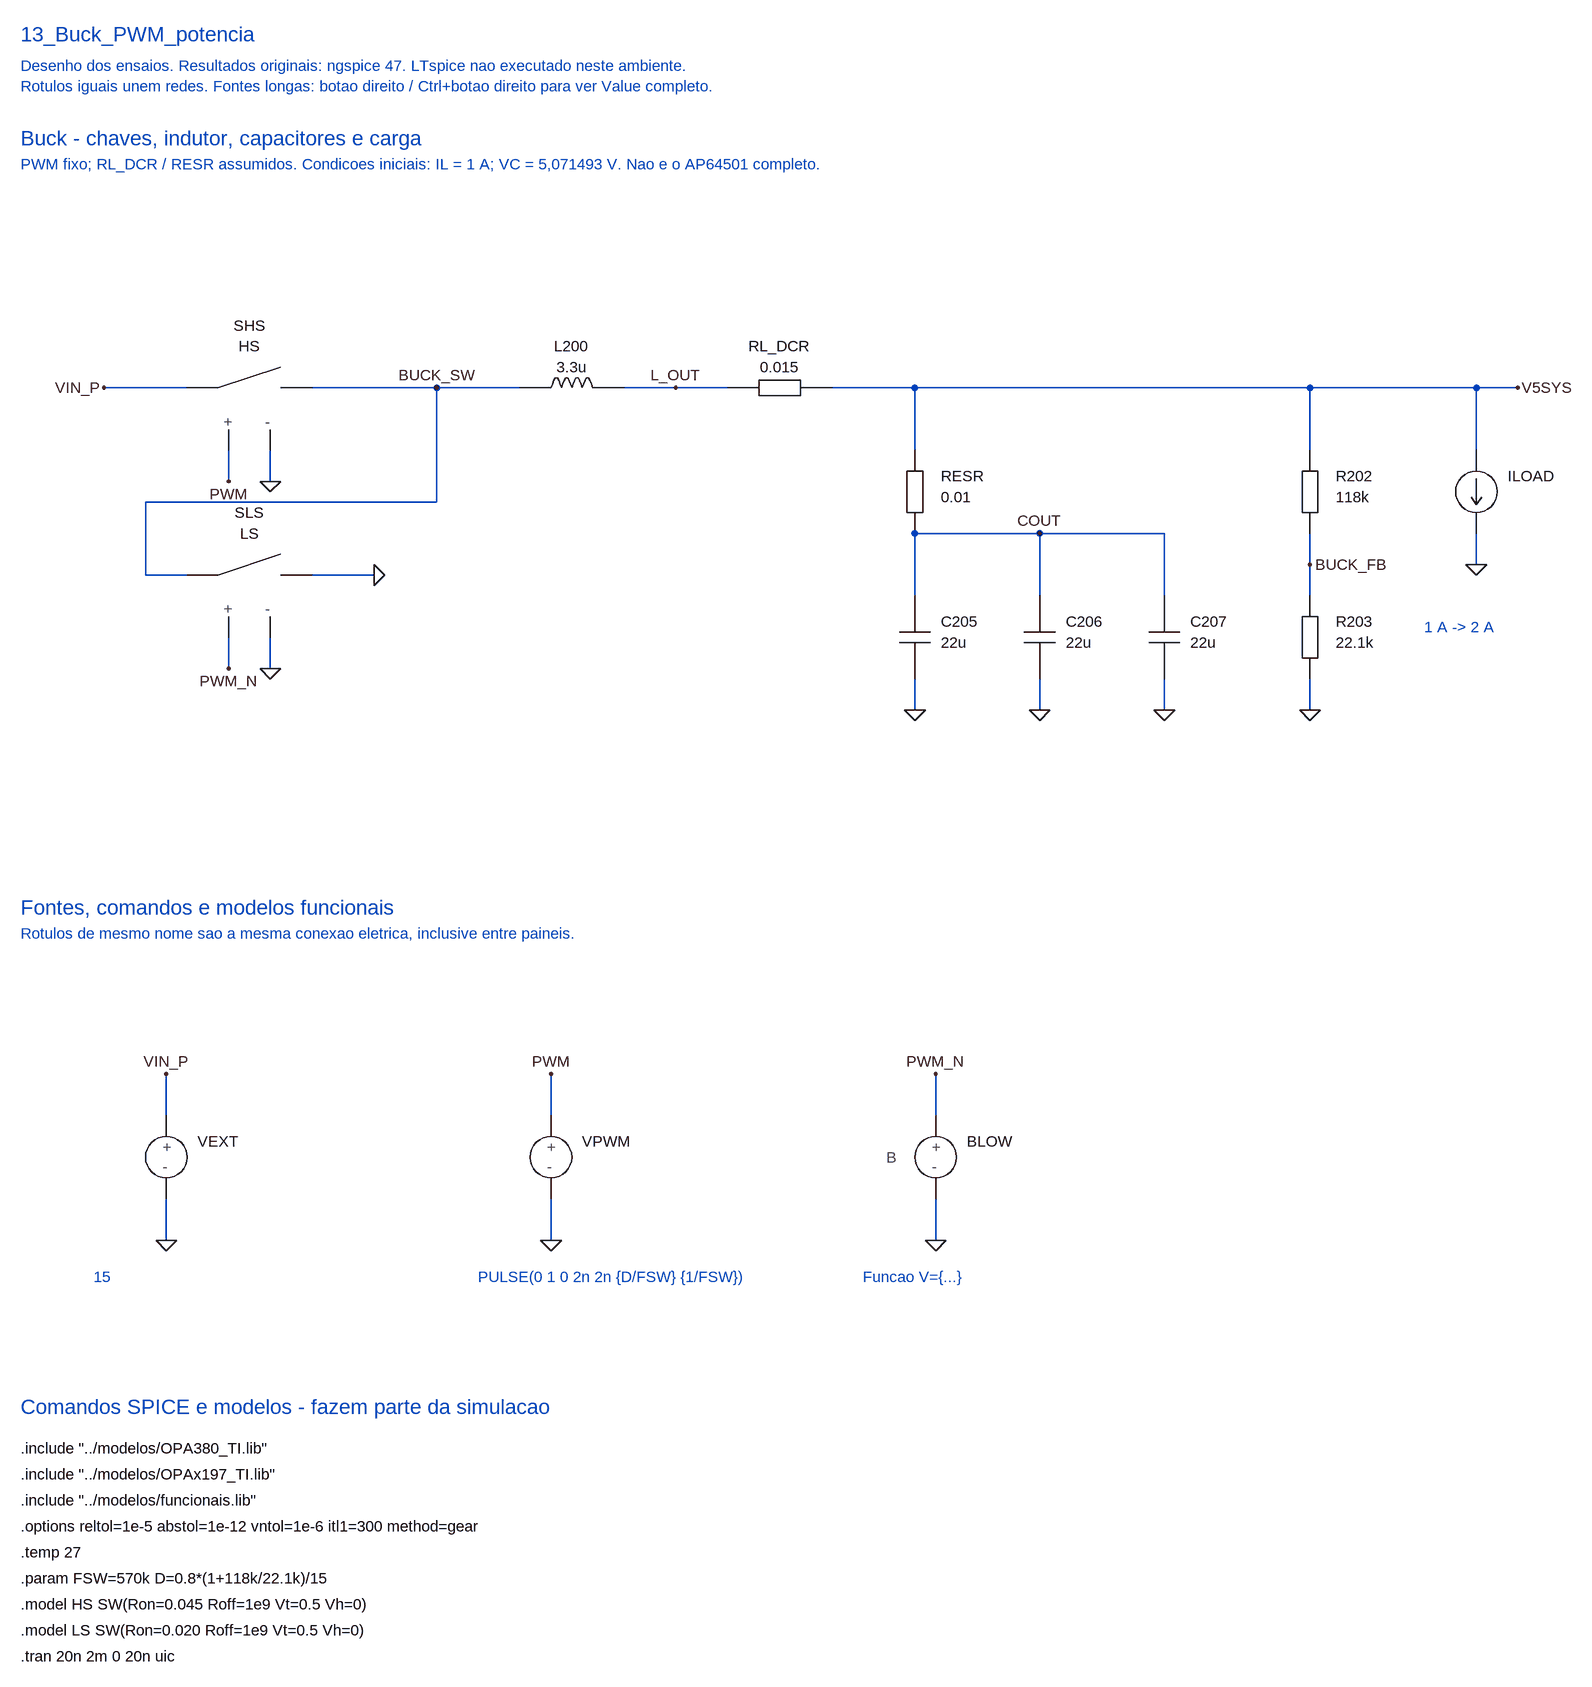
[diagram p0: schematic 13_Buck_PWM_potencia.asc]
13_Buck_PWM_potencia.asc, the LTspice schematic file:
Version 4.1
SHEET 1 2656 2664
TEXT 64 32 Left 3 ;13_Buck_PWM_potencia
TEXT 64 80 Left 2 ;Desenho dos ensaios. Resultados originais: ngspice 47. LTspice nao executado neste ambiente.
TEXT 64 112 Left 2 ;Rotulos iguais unem redes. Fontes longas: botao direito / Ctrl+botao direito para ver Value completo.
TEXT 64 192 Left 3 ;Buck - chaves, indutor, capacitores e carga
TEXT 64 232 Left 2 ;PWM fixo; RL_DCR / RESR assumidos. Condicoes iniciais: IL = 1 A; VC = 5,071493 V. Nao e o AP64501 completo.
WIRE 320 576 192 576
WIRE 512 576 832 576
WIRE 320 864 256 864
WIRE 256 864 256 752
WIRE 256 752 704 752
WIRE 704 752 704 576
WIRE 512 864 608 864
WIRE 384 672 384 720
WIRE 448 672 448 720
WIRE 384 960 384 1008
WIRE 448 960 448 1008
WIRE 992 576 1152 576
WIRE 1312 576 2368 576
WIRE 1440 576 1440 672
WIRE 1440 800 1824 800
WIRE 1440 800 1440 896
WIRE 1440 1024 1440 1072
WIRE 1632 800 1632 896
WIRE 1632 1024 1632 1072
WIRE 1824 800 1824 896
WIRE 1824 1024 1824 1072
WIRE 2048 576 2048 672
WIRE 2048 800 2048 896
WIRE 2048 1024 2048 1072
WIRE 2304 576 2304 672
WIRE 2304 800 2304 848
FLAG 192 576 VIN_P
FLAG 704 576 BUCK_SW
FLAG 608 864 0
FLAG 384 720 PWM
FLAG 448 720 0
FLAG 384 1008 PWM_N
FLAG 448 1008 0
FLAG 1072 576 L_OUT
FLAG 2368 576 V5SYS
FLAG 1632 800 COUT
FLAG 1440 1072 0
FLAG 1632 1072 0
FLAG 1824 1072 0
FLAG 2048 848 BUCK_FB
FLAG 2048 1072 0
FLAG 2304 848 0
SYMBOL CV_SW 384 576 R0
SYMATTR InstName SHS
SYMATTR Value HS
SYMBOL CV_SW 384 864 R0
SYMATTR InstName SLS
SYMATTR Value LS
SYMBOL CV_LH 832 576 R0
SYMATTR InstName L200
SYMATTR Value 3.3u
SYMATTR SpiceLine IC=1
SYMBOL CV_RH 1152 576 R0
SYMATTR InstName RL_DCR
SYMATTR Value 0.015
SYMBOL CV_RV 1440 672 R0
SYMATTR InstName RESR
SYMATTR Value 0.01
SYMBOL CV_CV 1440 896 R0
SYMATTR InstName C205
SYMATTR Value 22u
SYMATTR SpiceLine IC=5.071493
SYMBOL CV_CV 1632 896 R0
SYMATTR InstName C206
SYMATTR Value 22u
SYMATTR SpiceLine IC=5.071493
SYMBOL CV_CV 1824 896 R0
SYMATTR InstName C207
SYMATTR Value 22u
SYMATTR SpiceLine IC=5.071493
SYMBOL CV_RV 2048 672 R0
SYMATTR InstName R202
SYMATTR Value 118k
SYMBOL CV_RV 2048 896 R0
SYMATTR InstName R203
SYMATTR Value 22.1k
SYMBOL CV_I 2304 672 R0
SYMATTR InstName ILOAD
SYMATTR Value PWL(0 1 1m 1 1.001m 2)
TEXT 2224 944 Left 2 ;1 A -> 2 A
TEXT 64 1376 Left 3 ;Fontes, comandos e modelos funcionais
TEXT 64 1416 Left 2 ;Rotulos de mesmo nome sao a mesma conexao eletrica, inclusive entre paineis.
WIRE 288 1696 288 1632
WIRE 288 1824 288 1888
WIRE 880 1696 880 1632
WIRE 880 1824 880 1888
WIRE 1472 1696 1472 1632
WIRE 1472 1824 1472 1888
FLAG 288 1632 VIN_P
FLAG 288 1888 0
FLAG 880 1632 PWM
FLAG 880 1888 0
FLAG 1472 1632 PWM_N
FLAG 1472 1888 0
SYMBOL CV_V 288 1696 R0
SYMATTR InstName VEXT
SYMATTR Value 15
SYMBOL CV_V 880 1696 R0
SYMATTR InstName VPWM
SYMATTR Value PULSE(0 1 0 2n 2n {D/FSW} {1/FSW})
SYMBOL CV_B 1472 1696 R0
SYMATTR InstName BLOW
SYMATTR Value V={1-V(PWM)}
TEXT 176 1944 Left 2 ;15
TEXT 768 1944 Left 2 ;PULSE(0 1 0 2n 2n {D/FSW} {1/FSW})
TEXT 1360 1944 Left 2 ;Funcao V={...}
TEXT 64 2144 Left 3 ;Comandos SPICE e modelos - fazem parte da simulacao
TEXT 64 2208 Left 2 !.include "../modelos/OPA380_TI.lib"
TEXT 64 2248 Left 2 !.include "../modelos/OPAx197_TI.lib"
TEXT 64 2288 Left 2 !.include "../modelos/funcionais.lib"
TEXT 64 2328 Left 2 !.options reltol=1e-5 abstol=1e-12 vntol=1e-6 itl1=300 method=gear
TEXT 64 2368 Left 2 !.temp 27
TEXT 64 2408 Left 2 !.param FSW=570k D=0.8*(1+118k/22.1k)/15
TEXT 64 2448 Left 2 !.model HS SW(Ron=0.045 Roff=1e9 Vt=0.5 Vh=0)
TEXT 64 2488 Left 2 !.model LS SW(Ron=0.020 Roff=1e9 Vt=0.5 Vh=0)
TEXT 64 2528 Left 2 !.tran 20n 2m 0 20n uic

The netlist it stands for:
* 13_Buck_PWM_potencia.asc
SHS VIN_P BUCK_SW PWM 0 HS
SLS BUCK_SW 0 PWM_N 0 LS
L200 BUCK_SW L_OUT 3.3u IC=1
RL_DCR L_OUT V5SYS 0.015
RESR V5SYS COUT 0.01
C205 COUT 0 22u IC=5.071493
C206 COUT 0 22u IC=5.071493
C207 COUT 0 22u IC=5.071493
R202 V5SYS BUCK_FB 118k
R203 BUCK_FB 0 22.1k
ILOAD V5SYS 0 PWL(0 1 1m 1 1.001m 2)
VEXT VIN_P 0 15
VPWM PWM 0 PULSE(0 1 0 2n 2n {D/FSW} {1/FSW})
BLOW PWM_N 0 V={1-V(PWM)}
* 13_Buck_PWM_potencia
* Desenho dos ensaios. Resultados originais: ngspice 47. LTspice nao executado neste ambiente.
* Rotulos iguais unem redes. Fontes longas: botao direito / Ctrl+botao direito para ver Value completo.
* Buck - chaves, indutor, capacitores e carga
* PWM fixo; RL_DCR / RESR assumidos. Condicoes iniciais: IL = 1 A; VC = 5,071493 V. Nao e o AP64501 completo.
* 1 A -> 2 A
* Fontes, comandos e modelos funcionais
* Rotulos de mesmo nome sao a mesma conexao eletrica, inclusive entre paineis.
* 15
* PULSE(0 1 0 2n 2n {D/FSW} {1/FSW})
* Funcao V={...}
* Comandos SPICE e modelos - fazem parte da simulacao
.include "../modelos/OPA380_TI.lib"
.include "../modelos/OPAx197_TI.lib"
.include "../modelos/funcionais.lib"
.options reltol=1e-5 abstol=1e-12 vntol=1e-6 itl1=300 method=gear
.temp 27
.param FSW=570k D=0.8*(1+118k/22.1k)/15
.model HS SW(Ron=0.045 Roff=1e9 Vt=0.5 Vh=0)
.model LS SW(Ron=0.020 Roff=1e9 Vt=0.5 Vh=0)
.tran 20n 2m 0 20n uic
.backanno
.end